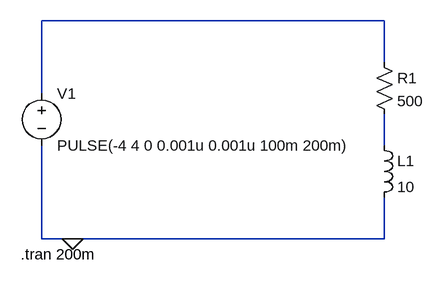
[diagram p0: schematic Draft3.asc]
Draft3.asc, the LTspice schematic file:
Version 4.1
SHEET 1 880 680
WIRE 320 16 -208 16
WIRE 320 80 320 16
WIRE -208 128 -208 16
WIRE 320 208 320 160
WIRE -208 352 -208 208
WIRE -160 352 -208 352
WIRE 320 352 320 288
WIRE 320 352 -160 352
FLAG -160 352 0
SYMBOL res 304 64 R0
SYMATTR InstName R1
SYMATTR Value 500
SYMBOL voltage -208 112 R0
WINDOW 123 0 0 Left 0
WINDOW 39 0 0 Left 0
SYMATTR InstName V1
SYMATTR Value PULSE(-4 4 0 0.001u 0.001u 100m 200m)
SYMBOL ind 304 192 R0
SYMATTR InstName L1
SYMATTR Value 10
SYMATTR SpiceLine Rser=1m
TEXT -240 376 Left 2 !.tran 200m

The netlist it stands for:
* Draft3.asc
R1 N001 N002 500
V1 N001 0 PULSE(-4 4 0 0.001u 0.001u 100m 200m)
L1 N002 0 10 Rser=1m
.tran 200m
.backanno
.end